# Altium schematic sheet 05_SoC_Interfaces.SchDoc
size A3; SheetNumber: 16; SheetTotal: 21
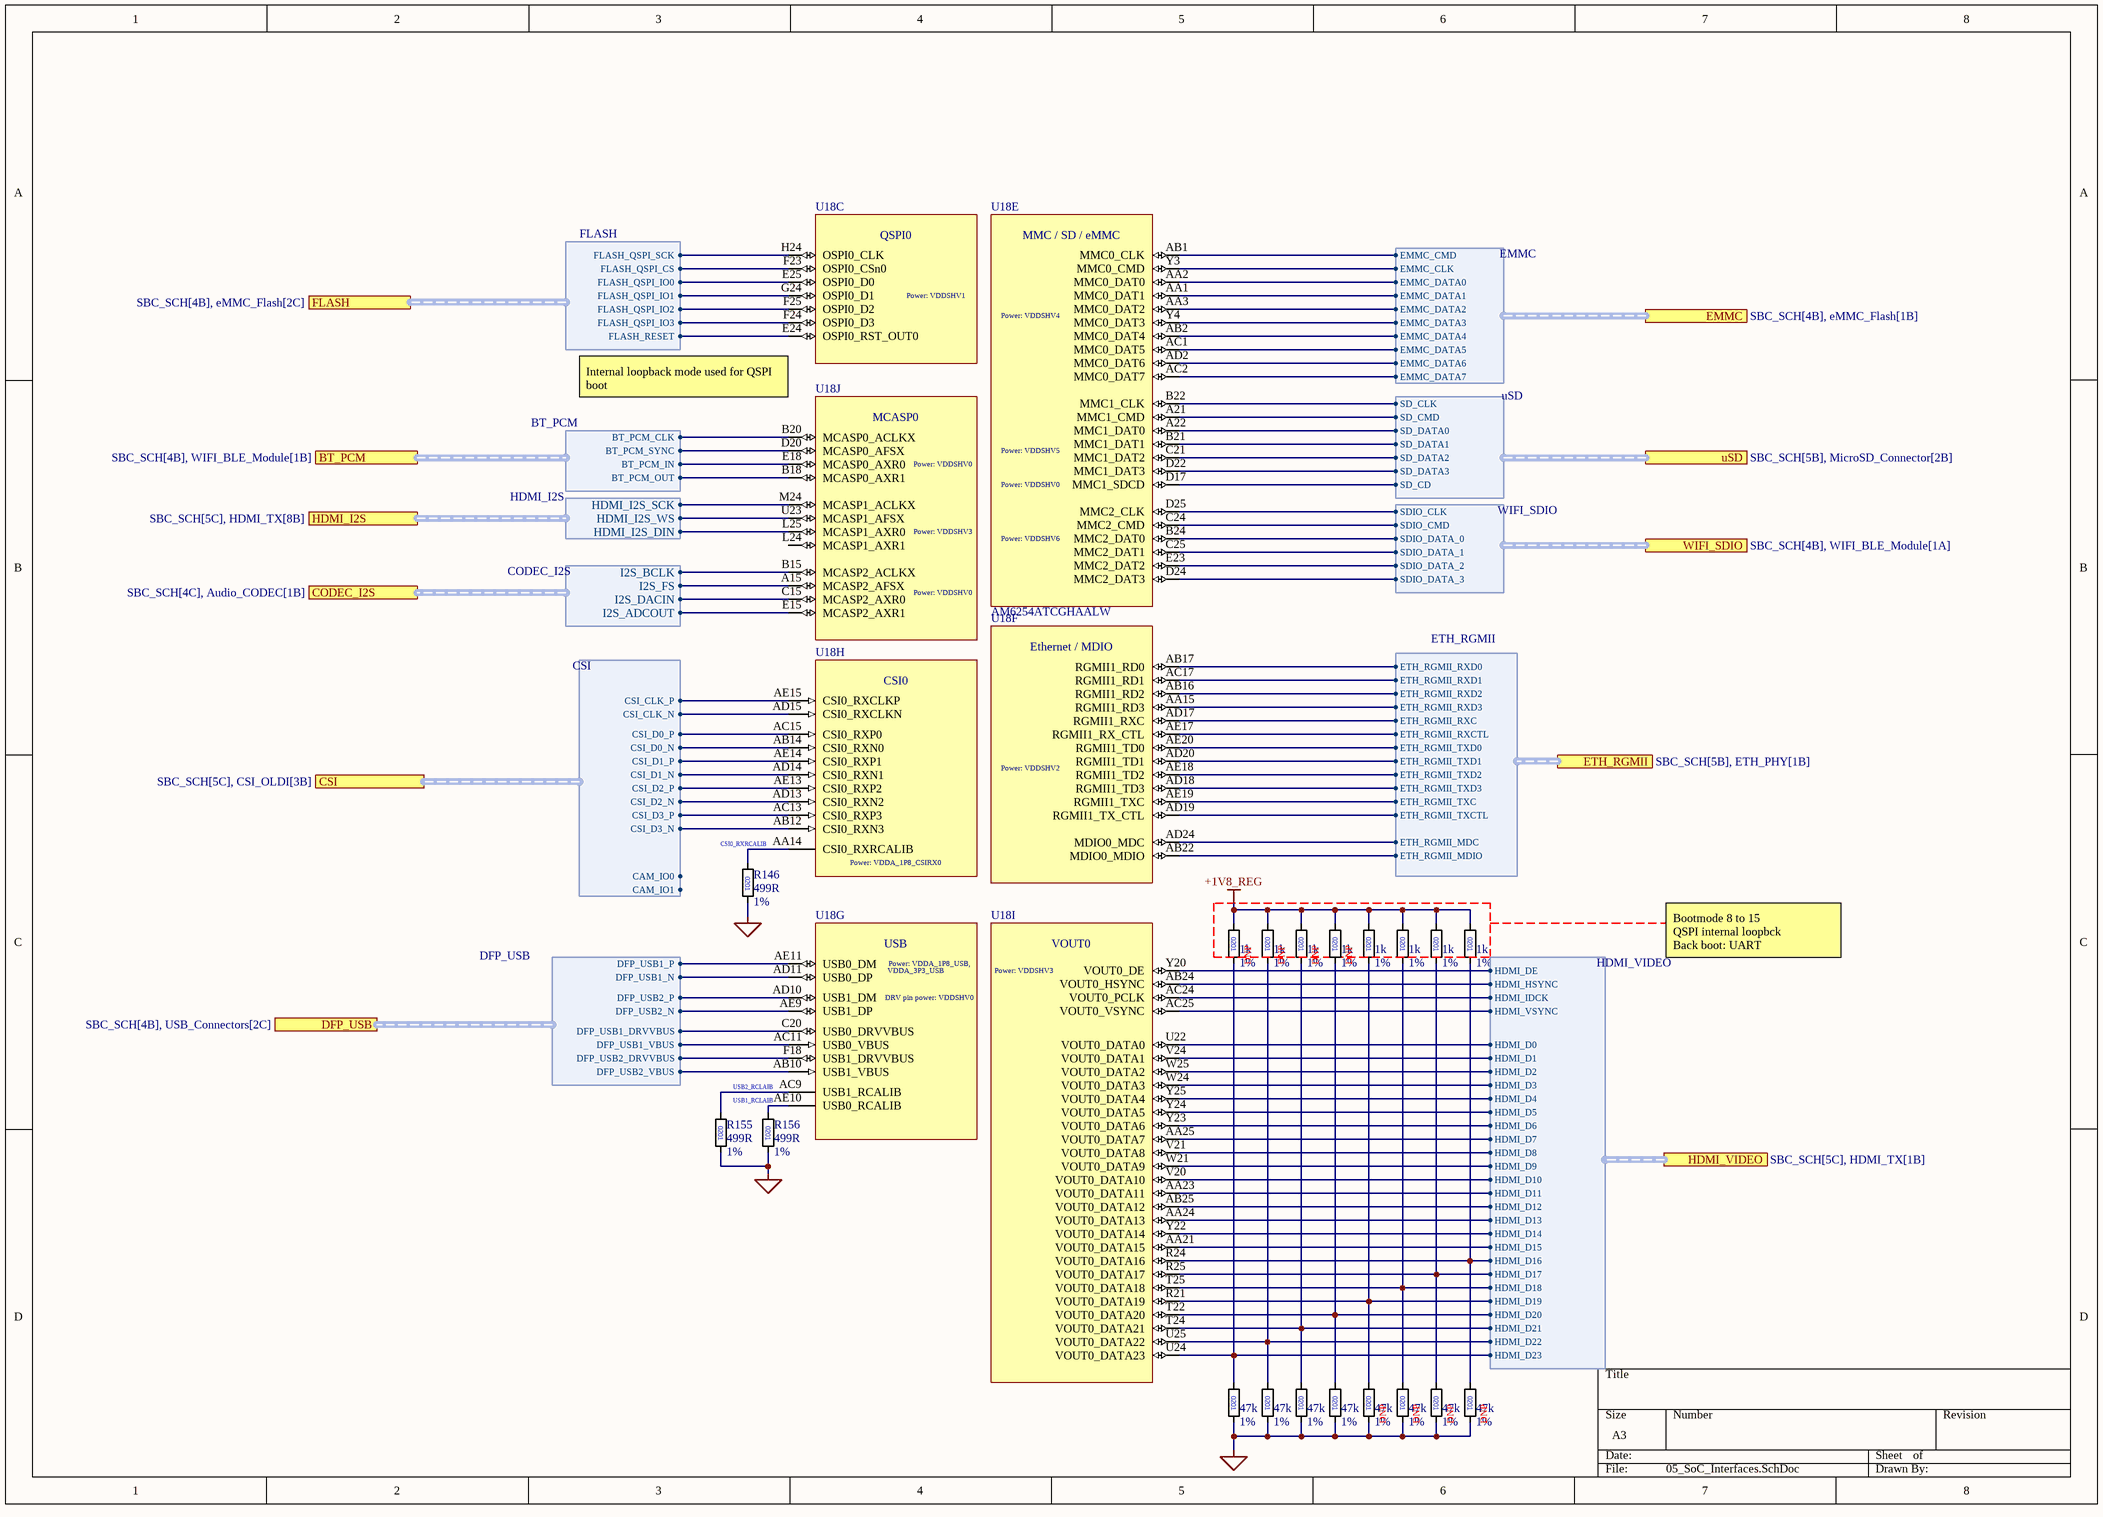
[diagram p0: 05_SoC_Interfaces.SchDoc]

## Parts
(Parts that share a designator on the sheet are numbered #1, #2 ... from top to bottom, then left to right.)
R146  value 499R  Tolerance: 1%  [R0201]  (hidden comment: 0201)
R147  value 1k  Tolerance: 1%  [R0201]  (hidden comment: 0201)
R148  value 1k  Tolerance: 1%  [R0201]  (hidden comment: 0201)
R149  value 1k  Tolerance: 1%  [R0201]  (hidden comment: 0201)
R150  value 1k  Tolerance: 1%  [R0201]  (hidden comment: 0201)
R151  value 1k  Tolerance: 1%  [R0201]  (hidden comment: 0201)
R152  value 1k  Tolerance: 1%  [R0201]  (hidden comment: 0201)
R153  value 1k  Tolerance: 1%  [R0201]  (hidden comment: 0201)
R154  value 1k  Tolerance: 1%  [R0201]  (hidden comment: 0201)
R155  value 499R  Tolerance: 1%  [R0201]  (hidden comment: 0201)
R156  value 499R  Tolerance: 1%  [R0201]  (hidden comment: 0201)
R157  value 47k  Tolerance: 1%  [R0201]  (hidden comment: 0201)
R158  value 47k  Tolerance: 1%  [R0201]  (hidden comment: 0201)
R159  value 47k  Tolerance: 1%  [R0201]  (hidden comment: 0201)
R160  value 47k  Tolerance: 1%  [R0201]  (hidden comment: 0201)
R161  value 47k  Tolerance: 1%  [R0201]  (hidden comment: 0201)
R162  value 47k  Tolerance: 1%  [R0201]  (hidden comment: 0201)
R163  value 47k  Tolerance: 1%  [R0201]  (hidden comment: 0201)
R164  value 47k  Tolerance: 1%  [R0201]  (hidden comment: 0201)
U18#1  AM6254ATCGHAALW  [AM6254ATCGHAALW]  (value not drawn)  (parts C,F,G,H,I,J of 15)
U18#2  AM6254ATCGHAALW  [AM6254ATCGHAALW]  (part E of 14)

## Ports
BT_PCM (harness BT_PCM, see SBC_SCH[4B], WIFI_BLE_Module[1B]), CODEC_I2S (harness CODEC_I2S, see SBC_SCH[4C], Audio_CODEC[1B]), CSI (harness CSI, see SBC_SCH[5C], CSI_OLDI[3B]), DFP_USB (harness DFP_USB, see SBC_SCH[4B], USB_Connectors[2C]), EMMC (harness EMMC, see SBC_SCH[4B], eMMC_Flash[1B]), ETH_RGMII (harness ETH_RGMII, see SBC_SCH[5B], ETH_PHY[1B]), FLASH (harness FLASH, see SBC_SCH[4B], eMMC_Flash[2C]), HDMI_I2S (harness HDMI_I2S, see SBC_SCH[5C], HDMI_TX[8B]), HDMI_VIDEO (harness HDMI_VIDEO, see SBC_SCH[5C], HDMI_TX[1B]), uSD (harness uSD, see SBC_SCH[5B], MicroSD_Connector[2B]), WIFI_SDIO (harness WIFI_SDIO, see SBC_SCH[4B], WIFI_BLE_Module[1A])

## Harnesses
EMMC: EMMC_DATA0, EMMC_DATA1, EMMC_DATA2, EMMC_DATA3, EMMC_DATA4, EMMC_DATA5, EMMC_DATA6, EMMC_DATA7, EMMC_CMD, EMMC_CLK
WIFI_SDIO: SDIO_DATA_0, SDIO_DATA_1, SDIO_DATA_2, SDIO_DATA_3, SDIO_CLK, SDIO_CMD
uSD: SD_DATA0, SD_DATA1, SD_DATA2, SD_DATA3, SD_CMD, SD_CLK, SD_CD
FLASH: FLASH_QSPI_SCK, FLASH_QSPI_CS, FLASH_QSPI_IO0, FLASH_QSPI_IO1, FLASH_QSPI_IO2, FLASH_QSPI_IO3, FLASH_RESET
BT_PCM: BT_PCM_CLK, BT_PCM_SYNC, BT_PCM_IN, BT_PCM_OUT
CODEC_I2S: I2S_BCLK, I2S_FS, I2S_ADCOUT, I2S_DACIN
ETH_RGMII: ETH_RGMII_RXD0, ETH_RGMII_RXD1, ETH_RGMII_RXD2, ETH_RGMII_RXD3, ETH_RGMII_RXC, ETH_RGMII_RXCTL, ETH_RGMII_TXD0, ETH_RGMII_TXD1, ETH_RGMII_TXD2, ETH_RGMII_TXD3, ETH_RGMII_TXC, ETH_RGMII_TXCTL, ETH_RGMII_MDC, ETH_RGMII_MDIO
HDMI_I2S: HDMI_I2S_SCK, HDMI_I2S_WS, HDMI_I2S_DIN
HDMI_VIDEO: HDMI_IDCK, HDMI_D0, HDMI_D1, HDMI_D2, HDMI_D3, HDMI_D4, HDMI_D5, HDMI_D6, HDMI_D7, HDMI_D8, HDMI_D9, HDMI_D10, HDMI_D11, HDMI_D12, HDMI_D13, HDMI_D14, HDMI_D15, HDMI_D16, HDMI_D17, HDMI_D18, HDMI_D19, HDMI_D20, HDMI_D21, HDMI_D22, HDMI_D23, HDMI_HSYNC, HDMI_VSYNC, HDMI_DE
CSI: CSI_D0_N, CSI_D0_P, CSI_D1_N, CSI_D1_P, CSI_CLK_N, CSI_CLK_P, CSI_D2_P, CSI_D2_N, CSI_D3_N, CSI_D3_P, CAM_IO0, CAM_IO1
DFP_USB: DFP_USB1_P, DFP_USB1_N, DFP_USB2_P, DFP_USB2_N, DFP_USB1_DRVVBUS, DFP_USB1_VBUS, DFP_USB2_DRVVBUS, DFP_USB2_VBUS

## Nets
+1V8_REG: R147.1 R148.1 R149.1 R150.1 R151.1 R152.1 R153.1 R154.1
GND: R146.2 R155.2 R156.2 R157.2 R158.2 R159.2 R160.2 R161.2 R162.2 R163.2 R164.2
CSI0_RXRCALIB: R146.1 U18#1.AA14(CSI0_RXRCALIB)
USB1_RCLAIB: R156.1 U18#1.AE10(USB0_RCALIB)
USB2_RCLAIB: R155.1 U18#1.AC9(USB1_RCALIB)
NetR147_2: R147.2 R157.1 U18#1.U24(VOUT0_DATA23) ; port HDMI_VIDEO.HDMI_D23
NetR148_2: R148.2 R158.1 U18#1.U25(VOUT0_DATA22) ; port HDMI_VIDEO.HDMI_D22
NetR149_2: R149.2 R159.1 U18#1.T24(VOUT0_DATA21) ; port HDMI_VIDEO.HDMI_D21
NetR150_2: R150.2 R160.1 U18#1.T22(VOUT0_DATA20) ; port HDMI_VIDEO.HDMI_D20
NetR151_2: R151.2 R161.1 U18#1.R21(VOUT0_DATA19) ; port HDMI_VIDEO.HDMI_D19
NetR152_2: R152.2 R162.1 U18#1.T25(VOUT0_DATA18) ; port HDMI_VIDEO.HDMI_D18
NetR153_2: R153.2 R163.1 U18#1.R25(VOUT0_DATA17) ; port HDMI_VIDEO.HDMI_D17
NetR154_2: R154.2 R164.1 U18#1.R24(VOUT0_DATA16) ; port HDMI_VIDEO.HDMI_D16
NetU18#1_A15: U18#1.A15(MCASP2_AFSX) ; port CODEC_I2S.I2S_FS
NetU18#1_AA15: U18#1.AA15(RGMII1_RD3) ; port ETH_RGMII.ETH_RGMII_RXD3
NetU18#1_AA21: U18#1.AA21(VOUT0_DATA15) ; port HDMI_VIDEO.HDMI_D15
NetU18#1_AA23: U18#1.AA23(VOUT0_DATA11) ; port HDMI_VIDEO.HDMI_D11
NetU18#1_AA24: U18#1.AA24(VOUT0_DATA13) ; port HDMI_VIDEO.HDMI_D13
NetU18#1_AA25: U18#1.AA25(VOUT0_DATA7) ; port HDMI_VIDEO.HDMI_D7
NetU18#1_AB10: U18#1.AB10(USB1_VBUS) ; port DFP_USB.DFP_USB2_VBUS
NetU18#1_AB12: U18#1.AB12(CSI0_RXN3) ; port CSI.CSI_D3_N
NetU18#1_AB14: U18#1.AB14(CSI0_RXN0) ; port CSI.CSI_D0_N
NetU18#1_AB16: U18#1.AB16(RGMII1_RD2) ; port ETH_RGMII.ETH_RGMII_RXD2
NetU18#1_AB17: U18#1.AB17(RGMII1_RD0) ; port ETH_RGMII.ETH_RGMII_RXD0
NetU18#1_AB22: U18#1.AB22(MDIO0_MDIO) ; port ETH_RGMII.ETH_RGMII_MDIO
NetU18#1_AB24: U18#1.AB24(VOUT0_HSYNC) ; port HDMI_VIDEO.HDMI_HSYNC
NetU18#1_AB25: U18#1.AB25(VOUT0_DATA12) ; port HDMI_VIDEO.HDMI_D12
NetU18#1_AC11: U18#1.AC11(USB0_VBUS) ; port DFP_USB.DFP_USB1_VBUS
NetU18#1_AC13: U18#1.AC13(CSI0_RXP3) ; port CSI.CSI_D3_P
NetU18#1_AC15: U18#1.AC15(CSI0_RXP0) ; port CSI.CSI_D0_P
NetU18#1_AC17: U18#1.AC17(RGMII1_RD1) ; port ETH_RGMII.ETH_RGMII_RXD1
NetU18#1_AC24: U18#1.AC24(VOUT0_PCLK) ; port HDMI_VIDEO.HDMI_IDCK
NetU18#1_AC25: U18#1.AC25(VOUT0_VSYNC) ; port HDMI_VIDEO.HDMI_VSYNC
NetU18#1_AD10: U18#1.AD10(USB1_DM) ; port DFP_USB.DFP_USB2_P
NetU18#1_AD11: U18#1.AD11(USB0_DP) ; port DFP_USB.DFP_USB1_N
NetU18#1_AD13: U18#1.AD13(CSI0_RXN2) ; port CSI.CSI_D2_N
NetU18#1_AD14: U18#1.AD14(CSI0_RXN1) ; port CSI.CSI_D1_N
NetU18#1_AD15: U18#1.AD15(CSI0_RXCLKN) ; port CSI.CSI_CLK_N
NetU18#1_AD17: U18#1.AD17(RGMII1_RXC) ; port ETH_RGMII.ETH_RGMII_RXC
NetU18#1_AD18: U18#1.AD18(RGMII1_TD3) ; port ETH_RGMII.ETH_RGMII_TXD3
NetU18#1_AD19: U18#1.AD19(RGMII1_TX_CTL) ; port ETH_RGMII.ETH_RGMII_TXCTL
NetU18#1_AD20: U18#1.AD20(RGMII1_TD1) ; port ETH_RGMII.ETH_RGMII_TXD1
NetU18#1_AD24: U18#1.AD24(MDIO0_MDC) ; port ETH_RGMII.ETH_RGMII_MDC
NetU18#1_AE9: U18#1.AE9(USB1_DP) ; port DFP_USB.DFP_USB2_N
NetU18#1_AE11: U18#1.AE11(USB0_DM) ; port DFP_USB.DFP_USB1_P
NetU18#1_AE13: U18#1.AE13(CSI0_RXP2) ; port CSI.CSI_D2_P
NetU18#1_AE14: U18#1.AE14(CSI0_RXP1) ; port CSI.CSI_D1_P
NetU18#1_AE15: U18#1.AE15(CSI0_RXCLKP) ; port CSI.CSI_CLK_P
NetU18#1_AE17: U18#1.AE17(RGMII1_RX_CTL) ; port ETH_RGMII.ETH_RGMII_RXCTL
NetU18#1_AE18: U18#1.AE18(RGMII1_TD2) ; port ETH_RGMII.ETH_RGMII_TXD2
NetU18#1_AE19: U18#1.AE19(RGMII1_TXC) ; port ETH_RGMII.ETH_RGMII_TXC
NetU18#1_AE20: U18#1.AE20(RGMII1_TD0) ; port ETH_RGMII.ETH_RGMII_TXD0
NetU18#1_B15: U18#1.B15(MCASP2_ACLKX) ; port CODEC_I2S.I2S_BCLK
NetU18#1_B18: U18#1.B18(MCASP0_AXR1) ; port BT_PCM.BT_PCM_OUT
NetU18#1_B20: U18#1.B20(MCASP0_ACLKX) ; port BT_PCM.BT_PCM_CLK
NetU18#1_C15: U18#1.C15(MCASP2_AXR0) ; port CODEC_I2S.I2S_DACIN
NetU18#1_C20: U18#1.C20(USB0_DRVVBUS) ; port DFP_USB.DFP_USB1_DRVVBUS
NetU18#1_D20: U18#1.D20(MCASP0_AFSX) ; port BT_PCM.BT_PCM_SYNC
NetU18#1_E15: U18#1.E15(MCASP2_AXR1) ; port CODEC_I2S.I2S_ADCOUT
NetU18#1_E18: U18#1.E18(MCASP0_AXR0) ; port BT_PCM.BT_PCM_IN
NetU18#1_E24: U18#1.E24(OSPI0_RST_OUT0) ; port FLASH.FLASH_RESET
NetU18#1_E25: U18#1.E25(OSPI0_D0) ; port FLASH.FLASH_QSPI_IO0
NetU18#1_F18: U18#1.F18(USB1_DRVVBUS) ; port DFP_USB.DFP_USB2_DRVVBUS
NetU18#1_F23: U18#1.F23(OSPI0_CSn0) ; port FLASH.FLASH_QSPI_CS
NetU18#1_F24: U18#1.F24(OSPI0_D3) ; port FLASH.FLASH_QSPI_IO3
NetU18#1_F25: U18#1.F25(OSPI0_D2) ; port FLASH.FLASH_QSPI_IO2
NetU18#1_G24: U18#1.G24(OSPI0_D1) ; port FLASH.FLASH_QSPI_IO1
NetU18#1_H24: U18#1.H24(OSPI0_CLK) ; port FLASH.FLASH_QSPI_SCK
NetU18#1_L25: U18#1.L25(MCASP1_AXR0) ; port HDMI_I2S.HDMI_I2S_DIN
NetU18#1_M24: U18#1.M24(MCASP1_ACLKX) ; port HDMI_I2S.HDMI_I2S_SCK
NetU18#1_U22: U18#1.U22(VOUT0_DATA0) ; port HDMI_VIDEO.HDMI_D0
NetU18#1_U23: U18#1.U23(MCASP1_AFSX) ; port HDMI_I2S.HDMI_I2S_WS
NetU18#1_V20: U18#1.V20(VOUT0_DATA10) ; port HDMI_VIDEO.HDMI_D10
NetU18#1_V21: U18#1.V21(VOUT0_DATA8) ; port HDMI_VIDEO.HDMI_D8
NetU18#1_V24: U18#1.V24(VOUT0_DATA1) ; port HDMI_VIDEO.HDMI_D1
NetU18#1_W21: U18#1.W21(VOUT0_DATA9) ; port HDMI_VIDEO.HDMI_D9
NetU18#1_W24: U18#1.W24(VOUT0_DATA3) ; port HDMI_VIDEO.HDMI_D3
NetU18#1_W25: U18#1.W25(VOUT0_DATA2) ; port HDMI_VIDEO.HDMI_D2
NetU18#1_Y20: U18#1.Y20(VOUT0_DE) ; port HDMI_VIDEO.HDMI_DE
NetU18#1_Y22: U18#1.Y22(VOUT0_DATA14) ; port HDMI_VIDEO.HDMI_D14
NetU18#1_Y23: U18#1.Y23(VOUT0_DATA6) ; port HDMI_VIDEO.HDMI_D6
NetU18#1_Y24: U18#1.Y24(VOUT0_DATA5) ; port HDMI_VIDEO.HDMI_D5
NetU18#1_Y25: U18#1.Y25(VOUT0_DATA4) ; port HDMI_VIDEO.HDMI_D4
NetU18#2_A21: U18#2.A21(MMC1_CMD) ; port uSD.SD_CMD
NetU18#2_A22: U18#2.A22(MMC1_DAT0) ; port uSD.SD_DATA0
NetU18#2_AA1: U18#2.AA1(MMC0_DAT1) ; port EMMC.EMMC_DATA1
NetU18#2_AA2: U18#2.AA2(MMC0_DAT0) ; port EMMC.EMMC_DATA0
NetU18#2_AA3: U18#2.AA3(MMC0_DAT2) ; port EMMC.EMMC_DATA2
NetU18#2_AB1: U18#2.AB1(MMC0_CLK) ; port EMMC.EMMC_CMD
NetU18#2_AB2: U18#2.AB2(MMC0_DAT4) ; port EMMC.EMMC_DATA4
NetU18#2_AC1: U18#2.AC1(MMC0_DAT5) ; port EMMC.EMMC_DATA5
NetU18#2_AC2: U18#2.AC2(MMC0_DAT7) ; port EMMC.EMMC_DATA7
NetU18#2_AD2: U18#2.AD2(MMC0_DAT6) ; port EMMC.EMMC_DATA6
NetU18#2_B21: U18#2.B21(MMC1_DAT1) ; port uSD.SD_DATA1
NetU18#2_B22: U18#2.B22(MMC1_CLK) ; port uSD.SD_CLK
NetU18#2_B24: U18#2.B24(MMC2_DAT0) ; port WIFI_SDIO.SDIO_DATA_0
NetU18#2_C21: U18#2.C21(MMC1_DAT2) ; port uSD.SD_DATA2
NetU18#2_C24: U18#2.C24(MMC2_CMD) ; port WIFI_SDIO.SDIO_CMD
NetU18#2_C25: U18#2.C25(MMC2_DAT1) ; port WIFI_SDIO.SDIO_DATA_1
NetU18#2_D17: U18#2.D17(MMC1_SDCD) ; port uSD.SD_CD
NetU18#2_D22: U18#2.D22(MMC1_DAT3) ; port uSD.SD_DATA3
NetU18#2_D24: U18#2.D24(MMC2_DAT3) ; port WIFI_SDIO.SDIO_DATA_3
NetU18#2_D25: U18#2.D25(MMC2_CLK) ; port WIFI_SDIO.SDIO_CLK
NetU18#2_E23: U18#2.E23(MMC2_DAT2) ; port WIFI_SDIO.SDIO_DATA_2
NetU18#2_Y3: U18#2.Y3(MMC0_CMD) ; port EMMC.EMMC_CLK
NetU18#2_Y4: U18#2.Y4(MMC0_DAT3) ; port EMMC.EMMC_DATA3

Not connected (* = marked no-connect by the designer): U18#1 L24(MCASP1_AXR1)

## Notes on the sheet
- (near U18#1) Internal loopback mode used for QSPI boot
- (near R147) DNP
- (near R148) DNP
- (near R149) DNP
- (near R150) DNP
- Bootmode 8 to 15
  QSPI internal loopbck
  Back boot: UART
- (near R161) DNP
- (near R162) DNP
- (near R163) DNP
- (near R164) DNP
- (in symbol AM6254ATCGHAALW, part C) QSPI0; Power: VDDSHV1
- (in symbol AM6254ATCGHAALW, part E) MMC / SD / eMMC; Power: VDDSHV4; Power: VDDSHV5; Power: VDDSHV0; Power: VDDSHV6
- (in symbol AM6254ATCGHAALW, part F) Ethernet / MDIO; Power: VDDSHV2
- (in symbol AM6254ATCGHAALW, part G) USB; Power: VDDA_1P8_USB,; DRV pin power: VDDSHV0
- (in symbol AM6254ATCGHAALW, part H) CSI0; Power: VDDA_1P8_CSIRX0
- (in symbol AM6254ATCGHAALW, part I) VOUT0; Power: VDDSHV3
- (in symbol AM6254ATCGHAALW, part J) MCASP0; Power: VDDSHV0; Power: VDDSHV3

## Library data of the parts
R146-R164 = R_0201: Manufacturer_Name: *; Manufacturer_Part_Number: *
U18#1 U18#2 = AM6254ATCGHAALW: TI AM6254, quad Cortex-A53 SoC, ALW 425-ball FCCSP 13x13mm 0.5mm pitch; separate interface and power units; Pinmux_Note: Each physical ball occurs once under its primary interface. See companion pinmux CSV for alternate functions. Multiplexable digital pads use bidirectional ERC type.; KiCad_Footprint: SamacSys_Parts:BGA425C50P25X25_1300X1300X89; MPN: AM6254ATCGHAALW; Footprint_Note: Unassigned: requires verified ALW0425 425-ball FCCSP, 13x13mm, 0.5mm pitch; do not substitute a fully populated BGA.; Datasheet: https://www.ti.com/lit/ds/symlink/am625.pdf; ComponentLink1Description: Datasheet; ComponentLink1URL: https://www.ti.com/lit/ds/symlink/am625.pdf